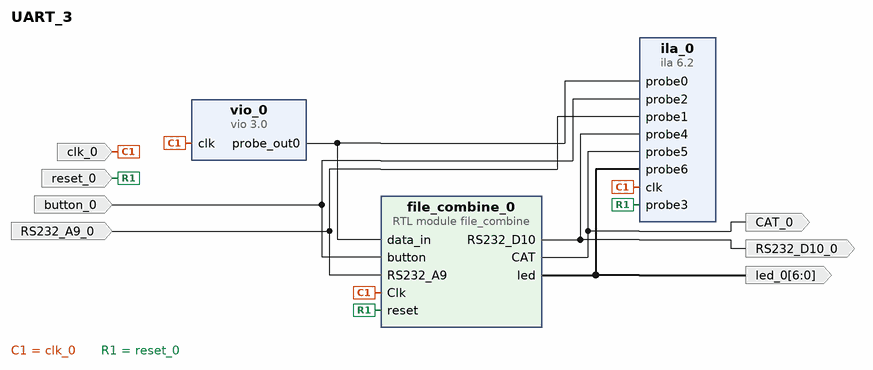
[diagram p0: block diagram of the top level]
# Vivado block design UART_3, xc7a35ticsg324-1L, Vivado 2020.2
create_bd_design UART_3

create_bd_port -dir I -type clk clk_0
create_bd_port -dir I -type rst reset_0
create_bd_port -dir I button_0
create_bd_port -dir I RS232_A9_0
create_bd_port -dir O RS232_D10_0
create_bd_port -dir O CAT_0
create_bd_port -dir O -from 6 -to 0 led_0

create_bd_cell -type ip -vlnv xilinx.com:ip:ila:6.2 ila_0
set_property -dict [list \
  CONFIG.C_ENABLE_ILA_AXI_MON false \
  CONFIG.C_MONITOR_TYPE Native \
  CONFIG.C_NUM_OF_PROBES 7 \
  CONFIG.C_PROBE0_WIDTH 8 \
  CONFIG.C_PROBE6_WIDTH 7 \
] [get_bd_cells ila_0]
create_bd_cell -type ip -vlnv xilinx.com:ip:vio:3.0 vio_0
set_property -dict {CONFIG.C_NUM_PROBE_IN 0 CONFIG.C_PROBE_OUT0_WIDTH 8} [get_bd_cells vio_0]
create_bd_cell -type module -reference file_combine file_combine_0

# ---- connections ----

connect_bd_net [get_bd_pins vio_0/probe_out0] [get_bd_pins file_combine_0/data_in] [get_bd_pins ila_0/probe0]
connect_bd_net -net clk_0_1 [get_bd_ports clk_0] [get_bd_pins ila_0/clk] [get_bd_pins vio_0/clk] [get_bd_pins file_combine_0/Clk]
connect_bd_net -net reset_0_1 [get_bd_ports reset_0] [get_bd_pins file_combine_0/reset] [get_bd_pins ila_0/probe3]
connect_bd_net -net button_0_1 [get_bd_ports button_0] [get_bd_pins file_combine_0/button] [get_bd_pins ila_0/probe2]
connect_bd_net -net RS232_A9_0_1 [get_bd_ports RS232_A9_0] [get_bd_pins file_combine_0/RS232_A9] [get_bd_pins ila_0/probe1]
connect_bd_net [get_bd_pins file_combine_0/RS232_D10] [get_bd_ports RS232_D10_0] [get_bd_pins ila_0/probe4]
connect_bd_net [get_bd_pins file_combine_0/CAT] [get_bd_ports CAT_0] [get_bd_pins ila_0/probe5]
connect_bd_net [get_bd_pins file_combine_0/led] [get_bd_ports led_0] [get_bd_pins ila_0/probe6]

validate_bd_design
save_bd_design
